# Altium schematic sheet DIGITAL_I-O_O-P.SchDoc
size A4; SheetNumber: 14; SheetTotal: 20
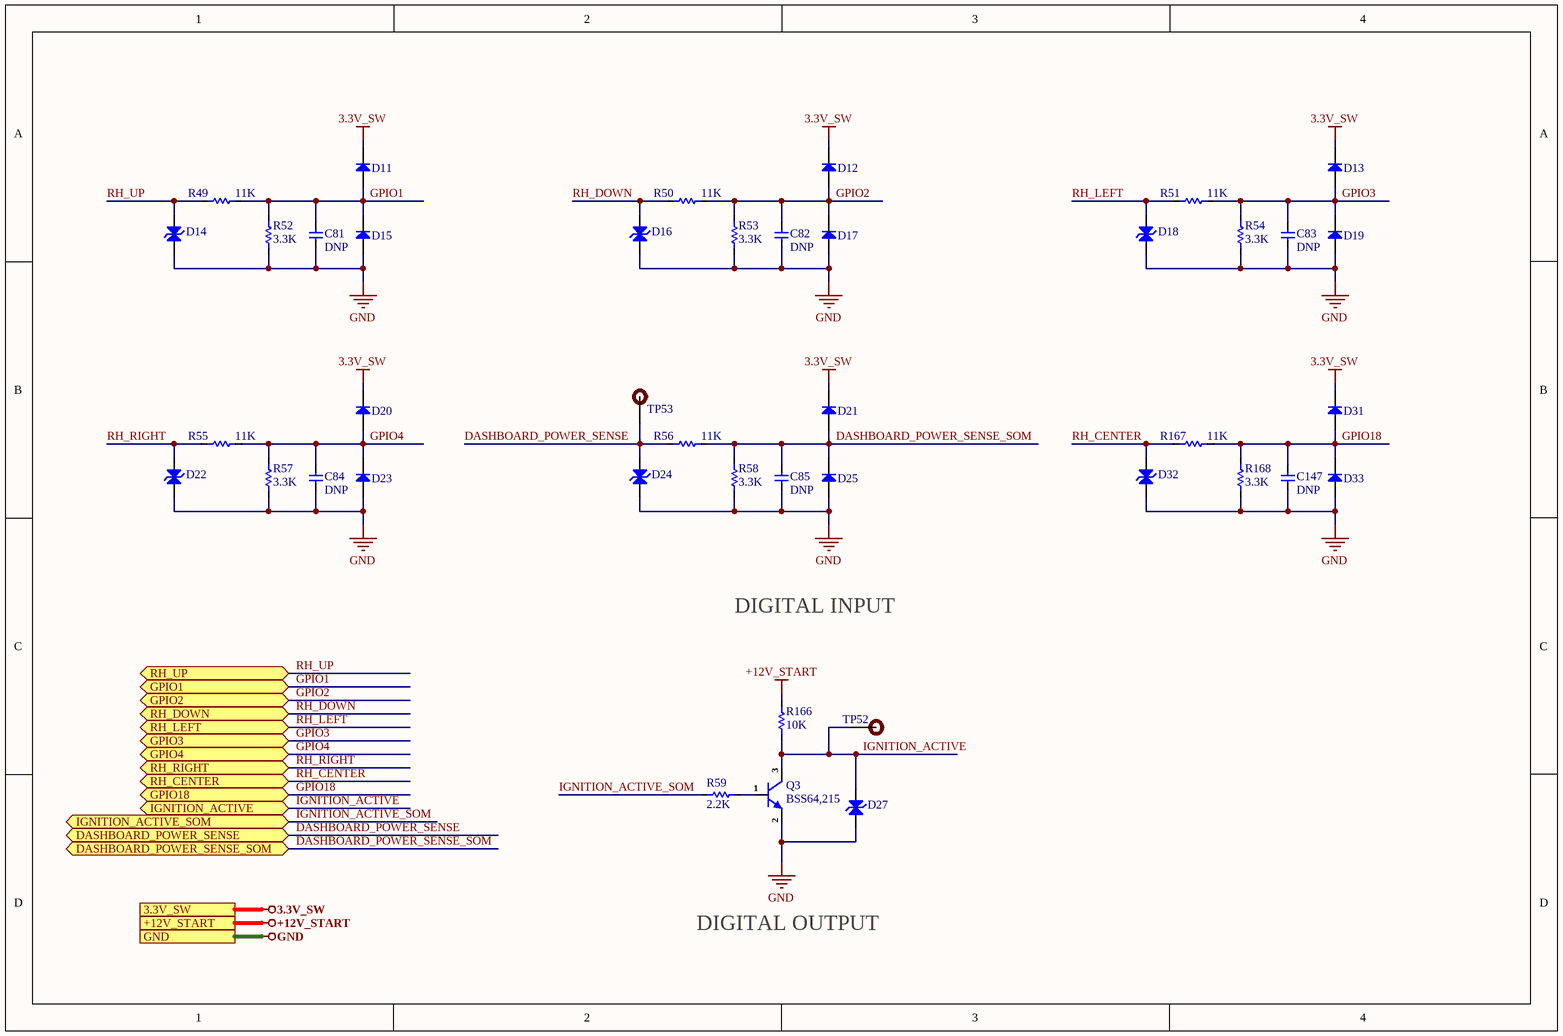
[diagram p0: DIGITAL_I-O_O-P.SchDoc]

## Parts
C81  DNP  [Cap-0603]
C82  DNP  [Cap-0603]
C83  DNP  [Cap-0603]
C84  DNP  [Cap-0603]
C85  DNP  [Cap-0603]
C147  DNP  [Cap-0603]
D11  BAS316,115  [SOD-323]  (value not drawn)
D12  BAS316,115  [SOD-323]  (value not drawn)
D13  BAS316,115  [SOD-323]  (value not drawn)
D14  SMAJ14CA-E3/61  [SMA]  (value not drawn)
D15  BAS316,115  [SOD-323]  (value not drawn)
D16  SMAJ14CA-E3/61  [SMA]  (value not drawn)
D17  BAS316,115  [SOD-323]  (value not drawn)
D18  SMAJ14CA-E3/61  [SMA]  (value not drawn)
D19  BAS316,115  [SOD-323]  (value not drawn)
D20  BAS316,115  [SOD-323]  (value not drawn)
D21  BAS316,115  [SOD-323]  (value not drawn)
D22  SMAJ14CA-E3/61  [SMA]  (value not drawn)
D23  BAS316,115  [SOD-323]  (value not drawn)
D24  SMAJ14CA-E3/61  [SMA]  (value not drawn)
D25  BAS316,115  [SOD-323]  (value not drawn)
D27  SMAJ14CA-E3/61  [SMA]  (value not drawn)
D31  BAS316,115  [SOD-323]  (value not drawn)
D32  SMAJ14CA-E3/61  [SMA]  (value not drawn)
D33  BAS316,115  [SOD-323]  (value not drawn)
Q3  BSS64,215  [SOT-23]
R49  11K  [Res-0603]
R50  11K  [Res-0603]
R51  11K  [Res-0603]
R52  3.3K  [Res-0603]
R53  3.3K  [Res-0603]
R54  3.3K  [Res-0603]
R55  11K  [Res-0603]
R56  11K  [Res-0603]
R57  3.3K  [Res-0603]
R58  3.3K  [Res-0603]
R59  2.2K  [Res-0603]
R166  10K  [Res-0603]
R167  11K  [Res-0603]
R168  3.3K  [Res-0603]
TP52  DNP  [Test-point]  (value not drawn)
TP53  DNP  [Test-point]  (value not drawn)

## Ports
3.3V_SW (see Top_Sheet[4B], ETHERNET_INTERFACE[1D], FUTURE_USE_CONNECTOR[1D], HDMI_INTERFACE[1D], I2C_INTERFACE[1B], MICRO_SD_CARD_INTERFACE[1D], UART_INTERFACE[1D]), +12V_START (see Top_Sheet[4A], CONNECTORS[1D], DC_DC_CONVERTER[1D], INPUT_SUPPLY_PROTECTION[1C]), DASHBOARD_POWER_SENSE (bidir, see Top_Sheet[3B], CONNECTORS[3D], GPIO_NC_INTERFACE[3D]), DASHBOARD_POWER_SENSE_SOM (bidir, see Top_Sheet[3B], GPIO_NC_INTERFACE[3D]), GND (see Top_Sheet[3A], 03-CAN2_SPI_CAN_CONTROLLER[1D], APALIS_POWER_SUPPLY[1D], CAN2_SPI_CAN_CONTROLLER[1D], CODEC_INTERFACE[1D], CONNECTORS[1D], DC_DC_CONVERTER[1D], ETHERNET_INTERFACE[1D], FUTURE_USE_CONNECTOR[1D], GPIO_NC_INTERFACE[4B], HDMI_INTERFACE[1D], I2C_INTERFACE[1B], INPUT_SUPPLY_PROTECTION[1D], LTE_MODULE[1D], MECHANICAL_FOR_PCB[1D], MICRO_SD_CARD_INTERFACE[1D], Reset_and_SDIO[1D], UART_INTERFACE[1D], USB3.0_INTERFACE[1D]), GPIO1 (bidir, see Top_Sheet[3B], FUTURE_USE_CONNECTOR[2C]), GPIO2 (bidir, see Top_Sheet[3B], FUTURE_USE_CONNECTOR[2C]), GPIO3 (bidir, see Top_Sheet[3B], FUTURE_USE_CONNECTOR[2C]), GPIO4 (bidir, see Top_Sheet[3B], FUTURE_USE_CONNECTOR[2C]), GPIO18 (bidir, see Top_Sheet[3B], GPIO_NC_INTERFACE[2A]), IGNITION_ACTIVE (bidir, see Top_Sheet[4B], CONNECTORS[4D]), IGNITION_ACTIVE_SOM (bidir, see Top_Sheet[4B], GPIO_NC_INTERFACE[1D]), RH_CENTER (bidir, see Top_Sheet[4B], CONNECTORS[4D]), RH_DOWN (bidir, see Top_Sheet[3B], CONNECTORS[4D]), RH_LEFT (bidir, see Top_Sheet[3B], CONNECTORS[4D]), RH_RIGHT (bidir, see Top_Sheet[3B], CONNECTORS[4D]), RH_UP (bidir, see Top_Sheet[3B], CONNECTORS[4D])

## Nets
3.3V_SW: D11.1(K) D12.1(K) D13.1(K) D20.1(K) D21.1(K) D31.1(K) ; port 3.3V_SW
+12V_START: R166.2 ; port +12V_START
GND: C81.1 C82.1 C83.1 C84.1 C85.1 C147.1 D14.1(A) D15.2(A) D16.1(A) D17.2(A) D18.1(A) D19.2(A) D22.1(A) D23.2(A) D24.1(A) D25.2(A) D27.1(A) D32.1(A) D33.2(A) Q3.2(E) R52.1 R53.1 R54.1 R57.1 R58.1 R168.1 ; port GND
DASHBOARD_POWER_SENSE: D24.2(A) R56.1 TP53.1 ; port DASHBOARD_POWER_SENSE
DASHBOARD_POWER_SENSE_SOM: C85.2 D21.2(A) D25.1(K) R56.2 R58.2 ; port DASHBOARD_POWER_SENSE_SOM
GPIO1: C81.2 D11.2(A) D15.1(K) R49.2 R52.2 ; port GPIO1
GPIO2: C82.2 D12.2(A) D17.1(K) R50.2 R53.2 ; port GPIO2
GPIO3: C83.2 D13.2(A) D19.1(K) R51.2 R54.2 ; port GPIO3
GPIO4: C84.2 D20.2(A) D23.1(K) R55.2 R57.2 ; port GPIO4
GPIO18: C147.2 D31.2(A) D33.1(K) R167.2 R168.2 ; port GPIO18
IGNITION_ACTIVE: D27.2(A) Q3.3(C) R166.1 TP52.1 ; port IGNITION_ACTIVE
IGNITION_ACTIVE_SOM: R59.1 ; port IGNITION_ACTIVE_SOM
RH_CENTER: D32.2(A) R167.1 ; port RH_CENTER
RH_DOWN: D16.2(A) R50.1 ; port RH_DOWN
RH_LEFT: D18.2(A) R51.1 ; port RH_LEFT
RH_RIGHT: D22.2(A) R55.1 ; port RH_RIGHT
RH_UP: D14.2(A) R49.1 ; port RH_UP
NetQ3_1: Q3.1(B) R59.2

## Notes on the sheet
- DIGITAL INPUT
- DIGITAL OUTPUT

## Library data of the parts
C81-C85 C147 = C1608NP01H101J080AA: CAP CER 100PF 50V NP0 0603; Manufacturer: TDK; Item Type: Capacitor; Supplier: Arrow Electronics; Supplier Part Number: C1608NP01H101J080AA; Manufacturer Part Number: C1608NP01H101J080AA; RoHS: Yes; Category: Ceramic Capacitors; Stock: 1236; Pricing: 1=0.1172, 10=0.0734, 25=0.0727, 50=0.0628, 100=0.0474, 250=0.0469, 500=0.0388, 1000=0.0313 (USD); ComponentLink1URL: http://www.mouser.com/ds/2/400/tdk_mlcc_commercial_general_en-542463.pdf?src-supplier=Mouser; ComponentLink1Description: http://www.mouser.com/ds/2/400/tdk_mlcc_commercial_general_en-542463.pdf?src-supplier=Mouser; ComponentLink2URL: https://datasheet.octopart.com/C1608NP01H101J080AA-TDK-datasheet-43914282.pdf?src-supplier=Future+Electronics; ComponentLink2Description: https://datasheet.octopart.com/C1608NP01H101J080AA-TDK-datasheet-43914282.pdf?src-supplier=Future+Electronics; ComponentLink3URL: https://product.tdk.com/info/en/catalog/datasheets/mlcc_commercial_hightemp_en.pdf?ref_disty=digikey&src-supplier=Digi-Key; ComponentLink3Description: https://product.tdk.com/info/en/catalog/datasheets/mlcc_commercial_hightemp_en.pdf?ref_disty=digikey&src-supplier=Digi-Key; ComponentLink4URL: https://product.tdk.com/info/en/documents/chara_sheet/C1608NP01H101J080AA.pdf?src-supplier=Digi-Key; ComponentLink4Description: https://product.tdk.com/info/en/documents/chara_sheet/C1608NP01H101J080AA.pdf?src-supplier=Digi-Key; ComponentLink5URL: http://product.tdk.com/en/catalog/datasheets/mlcc_commercial_hightemp_en.pdf?src-supplier=Avnet; ComponentLink5Description: http://product.tdk.com/en/catalog/datasheets/mlcc_commercial_hightemp_en.pdf?src-supplier=Avnet
D11-D13 D15 D17 D19-D21 D23 D25 D31 D33 = BAS316,115: Rectifier Diode Switching 100V 0.25A 4ns Automotive 2-Pin SOD-323 T/R; Manufacturer: Nexperia; Forward Current: 250mA; Max Forward Surge Current (Ifsm): 500mA; Value: 1.5pF; Max Reverse Current: 500nA; Supplier: Rs; Supplier Part Number: 1821844P; Manufacturer Part Number: BAS316,115; RoHS: Yes; Category: Rectifier Diodes; Stock: 258600; Pricing: 600=0.062, 1200=0.039, 1800=0.037, 2400=0.035 (GBP); Pins: 2NUMBER; Max Operating Temperature: 150°C; Max Repetitive Reverse Voltage (Vrrm): 100V; Packaging: 10Packaging; Reverse Voltage: 100V; Height: 1.1mm; RoHS Compliant: Yes; ComponentLink1URL: http://www.farnell.com/datasheets/1856332.pdf?src-supplier=Farnell; ComponentLink1Description: http://www.farnell.com/datasheets/1856332.pdf?src-supplier=Farnell; ComponentLink2URL: https://assets.nexperia.com/documents/data-sheet/BAS16_SER.pdf?src-supplier=Digi-Key; ComponentLink2Description: https://assets.nexperia.com/documents/data-sheet/BAS16_SER.pdf?src-supplier=Digi-Key; ComponentLink3URL: https://datasheet.octopart.com/BAS316%2C115-Nexperia-datasheet-77871323.pdf?src-supplier=Future+Electronics; ComponentLink3Description: https://datasheet.octopart.com/BAS316%2C115-Nexperia-datasheet-77871323.pdf?src-supplier=Future+Electronics; ComponentLink4URL: https://datasheet.octopart.com/BAS316%2C115-Nexperia-datasheet-32749520.pdf?src-supplier=Element14; ComponentLink4Description: https://datasheet.octopart.com/BAS316%2C115-Nexperia-datasheet-32749520.pdf?src-supplier=Element14; ComponentLink5URL: http://www.farnell.com/datasheets/1856332.pdf?src-supplier=Newark; ComponentLink5Description: http://www.farnell.com/datasheets/1856332.pdf?src-supplier=Newark; ComponentLink6URL: https://datasheet.octopart.com/BAS316%2C115-NXP-datasheet-5319124.pdf?src-supplier=TME; ComponentLink6Description: https://datasheet.octopart.com/BAS316%2C115-NXP-datasheet-5319124.pdf?src-supplier=TME
D14 D16 D18 D22 D24 D27 D32 = SMAJ14CA-E3/61: TVS DIODE 14VWM 23.2VC DO214AC; Manufacturer: Vishay Semiconductors; Supplier: Mouser; Supplier Part Number: 625-SMAJ14CA-E3; Manufacturer Part Number: SMAJ14CA-E3/61; RoHS: Yes; Category: TVS Diodes; Stock: 15510; Pricing: 1=0.48, 10=0.36, 50=0.36, 100=0.221, 1000=0.127, 10000=0.099 (USD); ComponentLink1URL: https://datasheet.ciiva.com/4515/smaj50a-241759-4515304.pdf?src-supplier=Mouser; ComponentLink1Description: https://datasheet.ciiva.com/4515/smaj50a-241759-4515304.pdf?src-supplier=Mouser; ComponentLink2URL: https://datasheet.ciiva.com/16382/smaj50a-16382075.pdf?src-supplier=Future+Electronics; ComponentLink2Description: https://datasheet.ciiva.com/16382/smaj50a-16382075.pdf?src-supplier=Future+Electronics
Q3 = BSS64,215: TRANS NPN 80V 0.1A TO236AB; Manufacturer: Nexperia; Supplier: Future Electronics; Supplier Part Number: 6621338; Manufacturer Part Number: BSS64,215; RoHS: Yes; Category: BJTs; Stock: 3000; Pricing: 3000=0.0487, 9000=0.047, 15000=0.0462, 60000=0.044, 90000=0.0427 (USD); Packaging: 10Packaging; ComponentLink1URL: https://datasheet.octopart.com/BSS64%2C215-Nexperia-datasheet-87581098.pdf?src-supplier=TME; ComponentLink1Description: https://datasheet.octopart.com/BSS64%2C215-Nexperia-datasheet-87581098.pdf?src-supplier=TME
R49-R51 R55 R56 R167 = RT0603DRD0711KL: RES SMD 11K OHM 0.5% 1/10W 0603; Manufacturer: Yageo; Supplier: Future Electronics; Supplier Part Number: 3061514; Manufacturer Part Number: RT0603DRD0711KL; RoHS: Yes; Category: Chip SMD Resistors; Stock: 70000; Pricing: 5000=0.0133, 15000=0.0128, 25000=0.0126, 100000=0.012, 150000=0.0117 (USD); ComponentLink1URL: https://datasheet.ciiva.com/8891/pyu-rt-1-to-0-05-rohs-l-4-8891301.pdf?src-supplier=Avnet; ComponentLink1Description: https://datasheet.ciiva.com/8891/pyu-rt-1-to-0-05-rohs-l-4-8891301.pdf?src-supplier=Avnet
R52-R54 R57 R58 R168 = ERJ-U3RD3301V: RES 3.3K OHM 0.5% 1/10W 0603 SMD; Manufacturer: Panasonic; Supplier: Mouser; Supplier Part Number: 667-ERJ-U3RD3301V; Manufacturer Part Number: ERJ-U3RD3301V; RoHS: No; Category: Chip SMD Resistors; Stock: 19153; Pricing: 1=0.19, 10=0.105, 50=0.105, 100=0.047, 1000=0.029, 10000=0.023 (USD)
R59 = ERA-3AED222V: RES SMD 2.2K OHM 0.5% 1/10W 0603; Manufacturer: Panasonic; Value: 2.2kR; Power Rating: 100mW; Voltage Rating: 150V; Temperature Coefficient: 25ppm/°C; Supplier: Digi-Key; Supplier Part Number: P123753DKR-ND; Manufacturer Part Number: ERA-3AED222V; RoHS: Yes; Category: Chip SMD Resistors; Pricing: 1=0.27, 10=0.23, 25=0.1672, 50=0.1212, 100=0.0899, 250=0.069, 500=0.05436, 1000=0.03763 (USD); Mounting Technology: Surface Mount; Case/Package: 0603; Case Code (Imperial): 0603; Case Code (Metric): 1608; Contact Plating: Tin; Min Operating Temperature: -55°C; Max Operating Temperature: 155°C; Tolerance: 0.5%; Package Quantity: 5000; Packaging: Tape and Reel; Series: ERA-3A; Features: Automotive AEC-Q200; Max Power Dissipation: 100mW; Number of Terminations: 2; Length: 1.6mm; Width: 0.8mm; Height: 0.45mm; Ratings: AEC-Q200; Lead Free: Lead Free; RoHS Compliant: Yes; ComponentLink1URL: https://datasheet.ciiva.com/24024/aoa0000ce26-197354-24024457.pdf?src-supplier=Mouser; ComponentLink1Description: https://datasheet.ciiva.com/24024/aoa0000ce26-197354-24024457.pdf?src-supplier=Mouser
R166 = RCA060310K0FKEAHP: RES SMD 10K OHM 1% 1/10W 0603; Manufacturer: Vishay Dale; Value: 10kR; Max Power Dissipation: 250mW; Temperature Coefficient: 100ppm/°C; Supplier: Future Electronics; Supplier Part Number: 4171415; Manufacturer Part Number: RCA060310K0FKEAHP; RoHS: Yes; Category: Chip SMD Resistors; Stock: 10000; Pricing: 5000=0.0413, 10000=0.0403, 15000=0.0397, 25000=0.0389, 50000=0.0374 (USD); Case/Package: 0603; Case Code (Imperial): 0603; Case Code (Metric): 1608; Min Operating Temperature: -55°C; Max Operating Temperature: 155°C; Features: Automotive AEC-Q200,Anti-Sulfur; Packaging: Cut Tape; Tolerance: 1%; Number of Terminations: 2; Series: RCA-HP; Ratings: AEC-Q200; RoHS Compliant: Yes; ComponentLink1URL: http://www.vishay.com/docs/20067/rcahp.pdf?src-supplier=Digi-Key; ComponentLink1Description: http://www.vishay.com/docs/20067/rcahp.pdf?src-supplier=Digi-Key
TP52 TP53 = TEST POINT: Test Point ON; Item Type: TEST POINT